# Altium schematic sheet MainMCU.SchDoc
size A; SheetNumber: 2; SheetTotal: 5
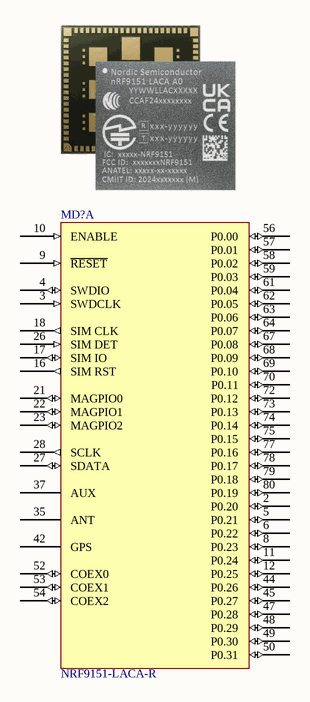
[diagram p0: MainMCU.SchDoc]

## Parts
MD?  NRF9151-LACA-R  [FP-nRF9151-LACA-R_MFG]  (part A of 2)

## Nets

Not connected (* = marked no-connect by the designer): MD? 2(P0.20) 3(SWDCLK) 4(SWDIO) 5(P0.21) 6(P0.22) 8(P0.23) 9(~{RESET}) 10(ENABLE) 11(P0.24) 12(P0.25) 16(SIM_RST) 17(SIM_IO) 18(SIM_CLK) 21(MAGPIO0) 22(MAGPIO1) 23(MAGPIO2) 26(SIM_DET) 27(SDATA) 28(SCLK) 35(ANT) 37(AUX) 42(GPS) 44(P0.26) 45(P0.27) 47(P0.28) 48(P0.29) 49(P0.30) 50(P0.31) 52(COEX0) 53(COEX1) 54(COEX2) 56(P0.00) 57(P0.01) 58(P0.02) 59(P0.03) 61(P0.04) 62(P0.05) 63(P0.06) 64(P0.07) 67(P0.08) 68(P0.09) 69(P0.10) 70(P0.11) 72(P0.12) 73(P0.13) 74(P0.14) 75(P0.15) 77(P0.16) 78(P0.17) 79(P0.18) 80(P0.19)

## Library data of the parts
MD? = CMP-03900-155507741-1: Low power SiP with integrated LTE-M/NB-IoT and DECT NR+ modem, and GNSS; ComponentLink1Description: Manufacturer URL; ComponentLink1URL: http://www.nordicsemi.com/; ComponentLink2Description: Datasheet URL; ComponentLink2URL: https://docs.nordicsemi.com/bundle/ps_nrf9151/page/mec_spec.html